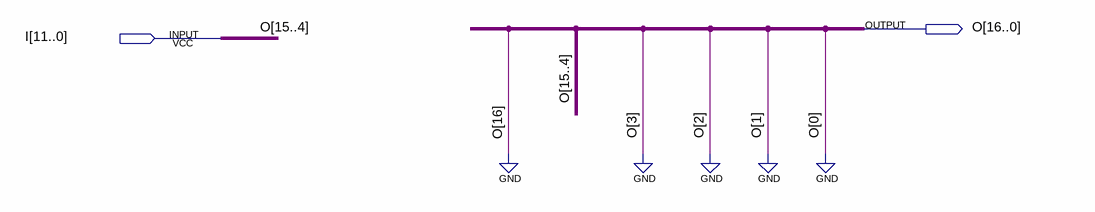
[diagram p0: schematic sheet]
// Quartus schematic mult4.bdf as structural Verilog: 0 symbols, 2 pins
module mult4 (
  input  [11:0] I,
  output [16:0] O
);


  assign O = {1'b0, I, 4'b0000};
endmodule
